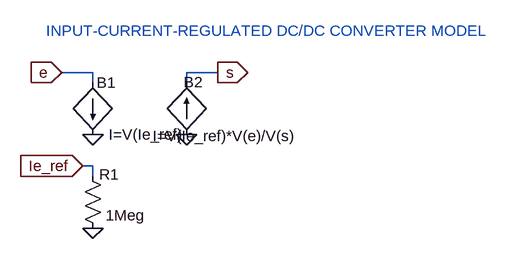
[diagram p0: schematic modelo_simplificado_cc_cc.asc]
modelo_simplificado_cc_cc.asc, the LTspice schematic file:
Version 4.1
SHEET 1 1452 740
WIRE 0 -32 -48 -32
WIRE 192 -32 144 -32
WIRE 0 -16 0 -32
WIRE 144 -16 144 -32
WIRE 0 112 -16 112
WIRE 0 128 0 112
FLAG -16 112 Ie_ref
IOPIN -16 112 In
FLAG 0 208 0
FLAG -48 -32 e
IOPIN -48 -32 In
FLAG 0 64 0
FLAG 192 -32 s
IOPIN 192 -32 Out
FLAG 144 64 0
SYMBOL res -16 112 R0
WINDOW 0 26 13 Left 2
SYMATTR InstName R1
SYMATTR Value 1Meg
SYMBOL bi 0 -16 R0
WINDOW 0 6 0 Left 2
SYMATTR InstName B1
SYMATTR Value I=V(Ie_ref)
SYMBOL bi 144 64 R180
WINDOW 0 -25 81 Left 2
WINDOW 3 -169 -2 Left 2
SYMATTR InstName B2
SYMATTR Value I=V(Ie_ref)*V(e)/V(s)
TEXT -72 -96 Left 2 ;INPUT-CURRENT-REGULATED DC/DC CONVERTER MODEL

The netlist it stands for:
* modelo_simplificado_cc_cc.asc
R1 Ie_ref 0 1Meg
B1 e 0 I=V(Ie_ref)
B2 0 s I=V(Ie_ref)*V(e)/V(s)
* INPUT-CURRENT-REGULATED DC/DC CONVERTER MODEL
.backanno
.end